# Altium schematic sheet TIA_LT1793.SchDoc
size A3
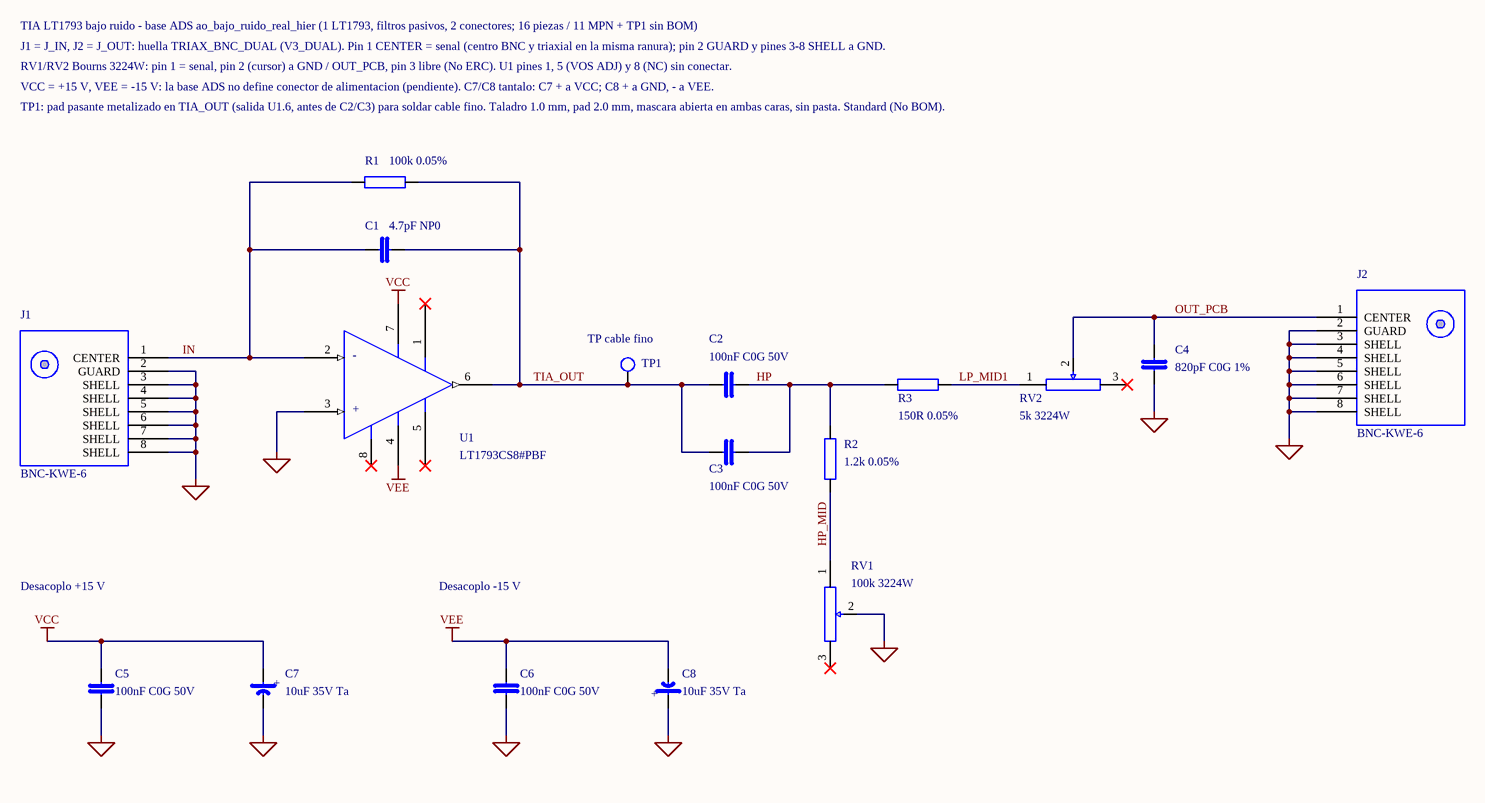
[diagram p0: TIA_LT1793.SchDoc]

## Parts
C1  4.7pF NP0  [C0603_IPC]
C2  100nF C0G 50V  [C1206_IPC]
C3  100nF C0G 50V  [C1206_IPC]
C4  820pF C0G 1%  [C0603_IPC]
C5  100nF C0G 50V  [C1206_IPC]
C6  100nF C0G 50V  [C1206_IPC]
C7  10uF 35V Ta  [CAPT_KEMET_D_7343-31]
C8  10uF 35V Ta  [CAPT_KEMET_D_7343-31]
J1  BNC-KWE-6  [TRIAX_BNC_DUAL]
J2  BNC-KWE-6  [TRIAX_BNC_DUAL]
R1  100k 0.05%  [R0805_IPC]
R2  1.2k 0.05%  [R0603_IPC]
R3  150R 0.05%  [R0603_IPC]
RV1  100k 3224W  [BOURNS_3224W]
RV2  5k 3224W  [BOURNS_3224W]
TP1  TP cable fino  [TP_PTH_D1R0_P2R0]  (no BOM)
U1  LT1793CS8#PBF  [SOIC127P600X175-8N]

## Nets
GND: C4.2 C5.2 C6.1 C7.2(-) C8.1(+) J1.2(GUARD) J1.3(SHELL) J1.4(SHELL) J1.5(SHELL) J1.6(SHELL) J1.7(SHELL) J1.8(SHELL) J2.2(GUARD) J2.3(SHELL) J2.4(SHELL) J2.5(SHELL) J2.6(SHELL) J2.7(SHELL) J2.8(SHELL) RV1.2(W) U1.3(+IN)
VCC: C5.1 C7.1(+) U1.7(V+)
VEE: C6.2 C8.2(-) U1.4(V-)
HP: C2.2 C3.2 R2.1 R3.1
HP_MID: R2.2 RV1.1
IN: C1.1 J1.1(CENTER) R1.1 U1.2(-IN)
LP_MID1: R3.2 RV2.1
OUT_PCB: C4.1 J2.1(CENTER) RV2.2(W)
TIA_OUT: C1.2 C2.1 C3.1 R1.2 TP1.1(TP) U1.6(OUT)

Not connected (* = marked no-connect by the designer): RV1 3*; RV2 3*; U1 1(VOS)* 5(VOS)* 8(NC)*

## Notes on the sheet
- TIA LT1793 bajo ruido - base ADS ao_bajo_ruido_real_hier (1 LT1793, filtros pasivos, 2 conectores; 16 piezas / 11 MPN + TP1 sin BOM)
- J1 = J_IN, J2 = J_OUT: huella TRIAX_BNC_DUAL (V3_DUAL). Pin 1 CENTER = senal (centro BNC y triaxial en la misma ranura); pin 2 GUARD y pines 3-8 SHELL a GND.
- RV1/RV2 Bourns 3224W: pin 1 = senal, pin 2 (cursor) a GND / OUT_PCB, pin 3 libre (No ERC). U1 pines 1, 5 (VOS ADJ) y 8 (NC) sin conectar.
- VCC = +15 V, VEE = -15 V: la base ADS no define conector de alimentacion (pendiente). C7/C8 tantalo: C7 + a VCC; C8 + a GND, - a VEE.
- TP1: pad pasante metalizado en TIA_OUT (salida U1.6, antes de C2/C3) para soldar cable fino. Taladro 1.0 mm, pad 2.0 mm, mascara abierta en ambas caras, sin pasta. Standard (No BOM).
- Desacoplo +15 V
- Desacoplo -15 V
- (in symbol LT1793CS8) -; +

## Library data of the parts
C1 = CAP_CC0603BRNPO9BN4R7: Condensador 4.7 pF +-0.1 pF NP0 0603 (C_F); Manufacturer: YAGEO; Manufacturer Part Number: CC0603BRNPO9BN4R7; LCSC: C327022; Footprint Ref: C0603_IPC; Rol ADS: C_F
C2 C3 = CAP_1206N104J500CT: Condensador 100 nF +-5 % C0G 50 V 1206 (C_HP1, C_HP2, C_DEC_*); Manufacturer: Walsin; Manufacturer Part Number: 1206N104J500CT; LCSC: C170182; Footprint Ref: C1206_IPC
  C2: Rol ADS: C_HP1
  C3: Rol ADS: C_HP2
C4 = CAP_GCM1885C2A821FA16D: Condensador 820 pF +-1 % C0G 100 V 0603 (C_LP); Manufacturer: Murata; Manufacturer Part Number: GCM1885C2A821FA16D; LCSC: C1864286; Footprint Ref: C0603_IPC; Rol ADS: C_LP
C5 = CAP_1206N104J500CT: Condensador 100 nF +-5 % C0G 50 V 1206 (C_HP1, C_HP2, C_DEC_*); Manufacturer: Walsin; Rol ADS: C_DEC_VCC; Manufacturer Part Number: 1206N104J500CT; LCSC: C170182; Footprint Ref: C1206_IPC
C6 = CAP_1206N104J500CT: Condensador 100 nF +-5 % C0G 50 V 1206 (C_HP1, C_HP2, C_DEC_*); Manufacturer: Walsin; Rol ADS: C_DEC_VEE; Manufacturer Part Number: 1206N104J500CT; LCSC: C170182; Footprint Ref: C1206_IPC
C7 = CAPT_T491D106K035AT: Condensador tantalo 10 uF 35 V caso D, polarizado: pin 1 = + (anodo); Manufacturer: KEMET; Rol ADS: C_BLK_VCC; Manufacturer Part Number: T491D106K035AT; LCSC: C122299; Footprint Ref: CAPT_KEMET_D_7343-31
C8 = CAPT_T491D106K035AT: Condensador tantalo 10 uF 35 V caso D, polarizado: pin 1 = + (anodo); Manufacturer: KEMET; Rol ADS: C_BLK_VEE; Manufacturer Part Number: T491D106K035AT; LCSC: C122299; Footprint Ref: CAPT_KEMET_D_7343-31
J1 = TRIAX_BNC_DUAL: BNC hembra acodado 50 Ohm cntitle BNC-KWE-6 en huella doble BNC/triaxial; Alt: Trompeter/Cinch CBBJR79 (triaxial) en la misma huella; Rol ADS: J_IN; Manufacturer: cntitle; Manufacturer Part Number: BNC-KWE-6; LCSC: C20415789; Footprint Ref: TRIAX_BNC_DUAL
J2 = TRIAX_BNC_DUAL: BNC hembra acodado 50 Ohm cntitle BNC-KWE-6 en huella doble BNC/triaxial; Alt: Trompeter/Cinch CBBJR79 (triaxial) en la misma huella; Rol ADS: J_OUT; Manufacturer: cntitle; Manufacturer Part Number: BNC-KWE-6; LCSC: C20415789; Footprint Ref: TRIAX_BNC_DUAL
R1 = RES_PTFR0805A100KN9: Resistencia 100 kOhm +-0.05 % 0805 (R_F); Manufacturer: Resi; Manufacturer Part Number: PTFR0805A100KN9; LCSC: C19679999; Footprint Ref: R0805_IPC; Rol ADS: R_F
R2 = RES_PTFR0603A1K20N9: Resistencia 1.2 kOhm +-0.05 % 0603 (R_HP); Manufacturer: Resi; Manufacturer Part Number: PTFR0603A1K20N9; LCSC: C47115537; Footprint Ref: R0603_IPC; Rol ADS: R_HP
R3 = RES_PTFR0603A150RP9: Resistencia 150 Ohm +-0.05 % 0603 (R_LP); Manufacturer: Resi; Manufacturer Part Number: PTFR0603A150RP9; LCSC: C19683979; Footprint Ref: R0603_IPC; Rol ADS: R_LP
RV1 = POT_3224W-1-104E: Trimmer 100 kOhm 12 vueltas Bourns 3224W (P_HP); Pinout: 1=extremo CCW (senal), 2=cursor, 3=extremo CW (libre); Rol ADS: P_HP (R_PHP); Manufacturer: Bourns; Manufacturer Part Number: 3224W-1-104E; LCSC: C53229; Footprint Ref: BOURNS_3224W
RV2 = POT_3224W-1-502E: Trimmer 5 kOhm 12 vueltas Bourns 3224W (P_LP); Pinout: 1=extremo CCW (senal), 2=cursor, 3=extremo CW (libre); Rol ADS: P_LP (R_PLP); Manufacturer: Bourns; Manufacturer Part Number: 3224W-1-502E; LCSC: C81349; Footprint Ref: BOURNS_3224W
TP1 = TP_PTH_D1R0_P2R0: Punto de test pasante metalizado para cable fino (taladro 1.0 mm, pad 2.0 mm). Sin componente de compra: excluido de BOM; Taladro: 1.0 mm metalizado; Pad: 2.0 mm redondo, mascara abierta ambas caras, sin pasta; Compra: No (pad de PCB; Standard No BOM); Rol ADS: TP (TIA_OUT, no en ADS); Footprint Ref: TP_PTH_D1R0_P2R0
U1 = LT1793CS8: Amplificador operacional JFET bajo ruido LT1793, SO-8; Manufacturer: Analog Devices (Linear Technology); Rol ADS: U1; Manufacturer Part Number: LT1793CS8#PBF; LCSC: C665301; Footprint Ref: SOIC127P600X175-8N